# Altium schematic sheet Block_ADCS_Sensing.SchDoc: Payload - Sistema de Cámara y Sensores
size A4; SheetNumber: 3; SheetTotal: 5
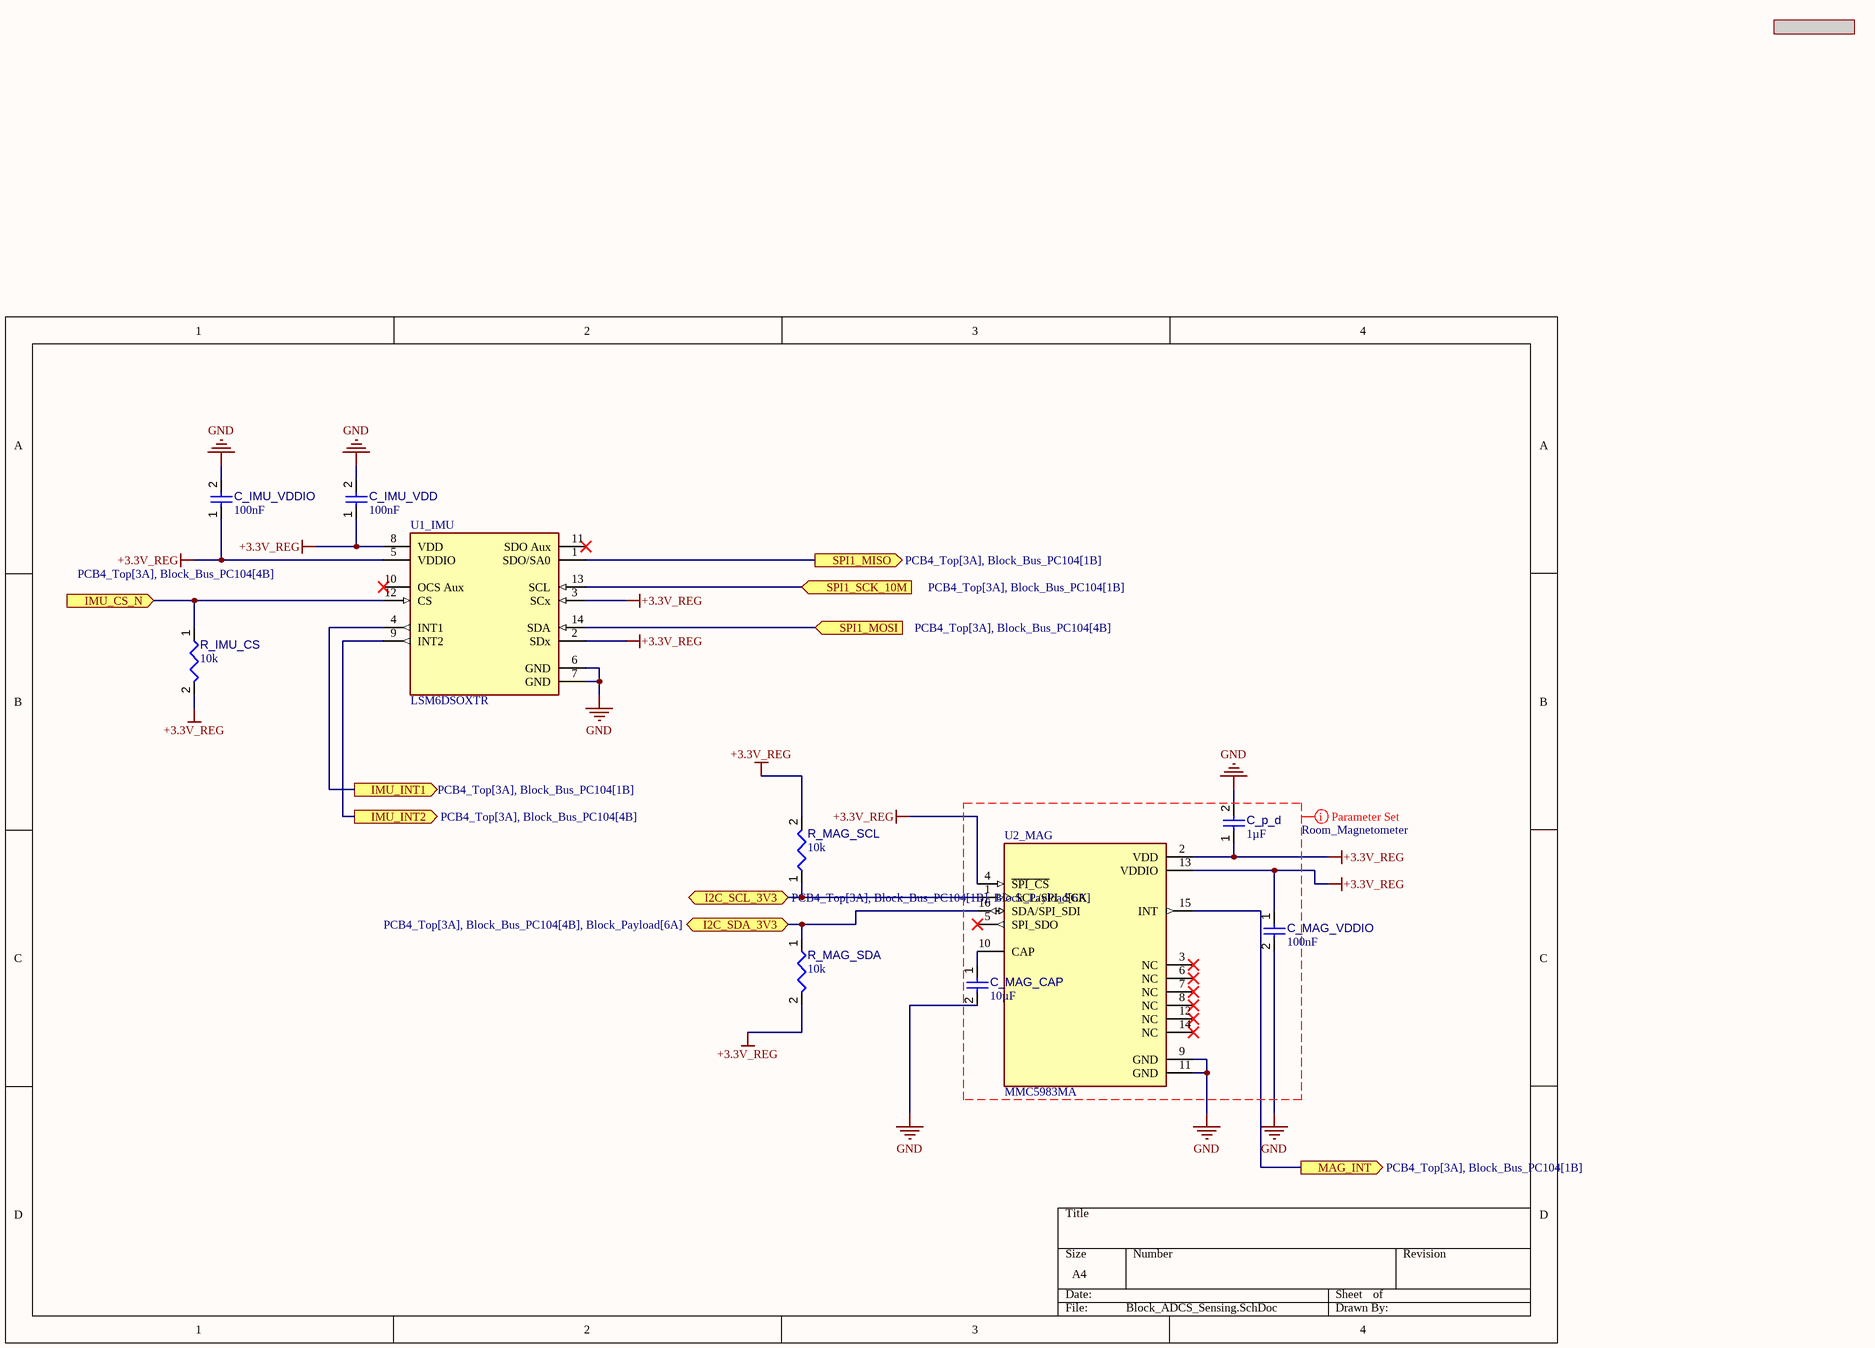
[diagram p0: Block_ADCS_Sensing.SchDoc]

## Parts
C_IMU_VDD  value 100nF  [CAPC1608X90X40NL10T20]  (hidden comment: Capacitor 100 nF +/-10% 50 V 0603)
C_IMU_VDDIO  value 100nF  [CAPC1608X90X40NL10T20]  (hidden comment: Capacitor 100 nF +/-10% 50 V 0603)
C_MAG_CAP  value 10µF  [CAPC2013X135X45NL10T25]  (hidden comment: Capacitor 10 uF +/- 10% 16 V 0805)
C_MAG_VDDIO  value 100nF  [CAPC1608X90X40NL10T20]  (hidden comment: Capacitor 100 nF +/-10% 50 V 0603)
C_p_d  value 1µF  [CAPC1608X90X35ML15T15]  (hidden comment: Capacitor 1uF +/- 10% 16V 0603)
R_IMU_CS  value 10k  [RESC1608X55X25ML10T15]  (hidden comment: Resistor 10k +/-1% 0603 100 mW)
R_MAG_SCL  value 10k  [RESC1608X55X25ML10T15]  (hidden comment: Resistor 10k +/-1% 0603 100 mW)
R_MAG_SDA  value 10k  [RESC1608X55X25ML10T15]  (hidden comment: Resistor 10k +/-1% 0603 100 mW)
U1_IMU  LSM6DSOXTR  [FP-LGA-14L-DM00249496-MFG]
U2_MAG  MMC5983MA  [PQFN50P300X300X100-16N]

## Ports
I2C_SCL_3V3 (bidir, see PCB4_Top[3A], Block_Bus_PC104[1B], Block_Payload[6A]), I2C_SDA_3V3 (bidir, see PCB4_Top[3A], Block_Bus_PC104[4B], Block_Payload[6A]), IMU_CS_N (in, see PCB4_Top[3A], Block_Bus_PC104[4B]), IMU_INT1 (out, see PCB4_Top[3A], Block_Bus_PC104[1B]), IMU_INT2 (out, see PCB4_Top[3A], Block_Bus_PC104[4B]), MAG_INT (out, see PCB4_Top[3A], Block_Bus_PC104[1B]), SPI1_MISO (out, see PCB4_Top[3A], Block_Bus_PC104[1B]), SPI1_MOSI (in, see PCB4_Top[3A], Block_Bus_PC104[4B]), SPI1_SCK_10M (in, see PCB4_Top[3A], Block_Bus_PC104[1B])

## Nets
+3.3V_REG: C_IMU_VDD.1 C_IMU_VDDIO.1 C_MAG_VDDIO.1 C_p_d.1 R_IMU_CS.2 R_MAG_SCL.2 R_MAG_SDA.2 U1_IMU.2(SDx) U1_IMU.3(SCx) U1_IMU.5(VDDIO) U1_IMU.8(VDD) U2_MAG.2(VDD) U2_MAG.4(~{SPI_CS}) U2_MAG.13(VDDIO)
GND: C_IMU_VDD.2 C_IMU_VDDIO.2 C_MAG_CAP.2 C_MAG_VDDIO.2 C_p_d.2 U1_IMU.6(GND) U1_IMU.7(GND) U2_MAG.9(GND) U2_MAG.11(GND)
I2C_SCL_3V3: R_MAG_SCL.1 U2_MAG.1(SCL/SPI_SCK) ; port I2C_SCL_3V3
I2C_SDA_3V3: R_MAG_SDA.1 U2_MAG.16(SDA/SPI_SDI) ; port I2C_SDA_3V3
IMU_CS_N: R_IMU_CS.1 U1_IMU.12(CS) ; port IMU_CS_N
IMU_INT1: U1_IMU.4(INT1) ; port IMU_INT1
IMU_INT2: U1_IMU.9(INT2) ; port IMU_INT2
MAG_INT: U2_MAG.15(INT) ; port MAG_INT
SPI1_MISO: U1_IMU.1(SDO/SA0) ; port SPI1_MISO
SPI1_MOSI: U1_IMU.14(SDA) ; port SPI1_MOSI
SPI1_SCK_10M: U1_IMU.13(SCL) ; port SPI1_SCK_10M
NetC_MAG_CAP_1: C_MAG_CAP.1 U2_MAG.10(CAP)

Not connected (* = marked no-connect by the designer): U1_IMU 10(OCS_Aux)* 11(SDO_Aux)*; U2_MAG 3(NC)* 5(SPI_SDO)* 6(NC)* 7(NC)* 8(NC)* 12(NC)* 14(NC)*

## Layout directives
CompClassName: Room_Magnetometer: (no net found under the mark)

## Library data of the parts
C_IMU_VDD C_IMU_VDDIO C_MAG_VDDIO = CMP-001-00017-6: Chip Capacitor, 100 nF, +/- 10%, 50 V, 0603 (1608 Metric); Voltage Rating: 50V; Capacitor Type: Ceramic; Tolerance: 10%; Mounting Technology: SM; Max Operating Temperature: 125°C; RoHS Compliant: True; Pins: 2; Case/Package: 0603; Min Operating Temperature: -55°C
C_MAG_CAP = CMP-001-00015-6: Chip Capacitor, 10 uF, +/- 10%, 16 V, 0805 (2012 Metric); Voltage Rating: 16V; Capacitor Type: Ceramic; RoHS Compliant: True; Max Operating Temperature: 85°C; Min Operating Temperature: -55°C; Mounting Technology: SM; Tolerance: 10%; Case/Package: 0805; Pins: 2
C_p_d = CMP-001-00004-6: Chip Capacitor, 1 uF, +/- 10%, 16 V, 0603 (1608 Metric); Capacitor Type: Ceramic; Mounting Technology: SM; RoHS Compliant: True; Min Operating Temperature: -55°C; Case/Package: 0603; Pins: 2; Voltage Rating: 16V; Max Operating Temperature: 125°C; Tolerance: 10%
R_IMU_CS R_MAG_SCL R_MAG_SDA = CMP-009-00017-5: Chip Resistor, 10 KOhm, +/- 1%, 01 W, -55 to 155 degC, 0603 (1608 Metric); Voltage Rating: 50V; Power: 100mW; RoHS Compliant: True; Min Operating Temperature: -55°C; Pins: 2; Case/Package: 0603; Mounting Technology: SM; Max Operating Temperature: 155°C; Tolerance: 1%
U1_IMU = CMP-12177-000010-1: INEMO INERTIAL MODULE: 3D ACCELE; Manufacturer: STMicroelectronics; Sensor Type: Temperature,Accelerometer,Gyroscope; Accel Range: 2/4/8/16g; Accel Sensitivity: 0.061/0.122/0.244/0.488mV/g; Operating Supply Current: 0.55mA; Gyro Range: 125/250/500/1000/2000°/s; Gyro Sensitivity: 4.375/8.75/17.5/35/70LSB/°/s; Sensor Output: I2C,SPI,Other; Min Supply Voltage: 1.62V; Max Supply Voltage: 3.6V; Octopart: https://octopart.com/lsm6dsoxtr-stmicroelectronics-98102600; Package: LGA-14L-DM00249496; Footprint Url: https://www.st.com/content/ccc/resource/technical/document/technical_note/73/17/9c/16/dd/96/4a/01/CD00134799.pdf/files/CD00134799.pdf/jcr:content/translations/en.CD00134799.pdf; ComponentLink2Description: Datasheet; Mouser Description: LSM6DSOX: 3.6 V 3 Axis Accelerometer Gyroscope iNEMO Inertial Module - LGA-14L; ComponentLink2URL: https://www.st.com/resource/en/datasheet/lsm6dsox.pdf; Temperature Range Low: -40°C; Digikey Description: INEMO INERTIAL MODULE: 3D ACCELE; Lead Free: Yes; Device Class L3: Inertial Measurement Units (IMUs); Category: IC; Device Class L2: Motion Sensors; RoHS: TRUE; Temperature: -40°C to +85°C; Height: 0.86mm; Device Class L1: Sensors; Temperature Range High: +85°C; Manufacturer Part Number: LSM6DSOXTR; Automotive: No
U2_MAG = MMC5983MA: MMC5983 series Magnetic, Magnetometer Sensor Evaluation Board; Manufacturer: MEMSIC; MF: Memsic Inc.; Purchase-URL: https://pricing.snapeda.com/search/part/MMC5983MA/?ref=eda; Price: None; Check_prices: https://www.snapeda.com/parts/MMC5983MA/Memsic+Inc./view-part/?ref=eda; SnapEDA_Link: https://www.snapeda.com/parts/MMC5983MA/Memsic+Inc./view-part/?ref=snap; Package: VFLGA-16 Memsic Inc.; Availability: In Stock; MP: MMC5983MA; Value: *; Manufacturer Part Number: MMC5983MA; Reference: MMC5983MA